# Altium project TYPEC_4KTransmitter-v1.0.PrjPcb (part 1 of 11)
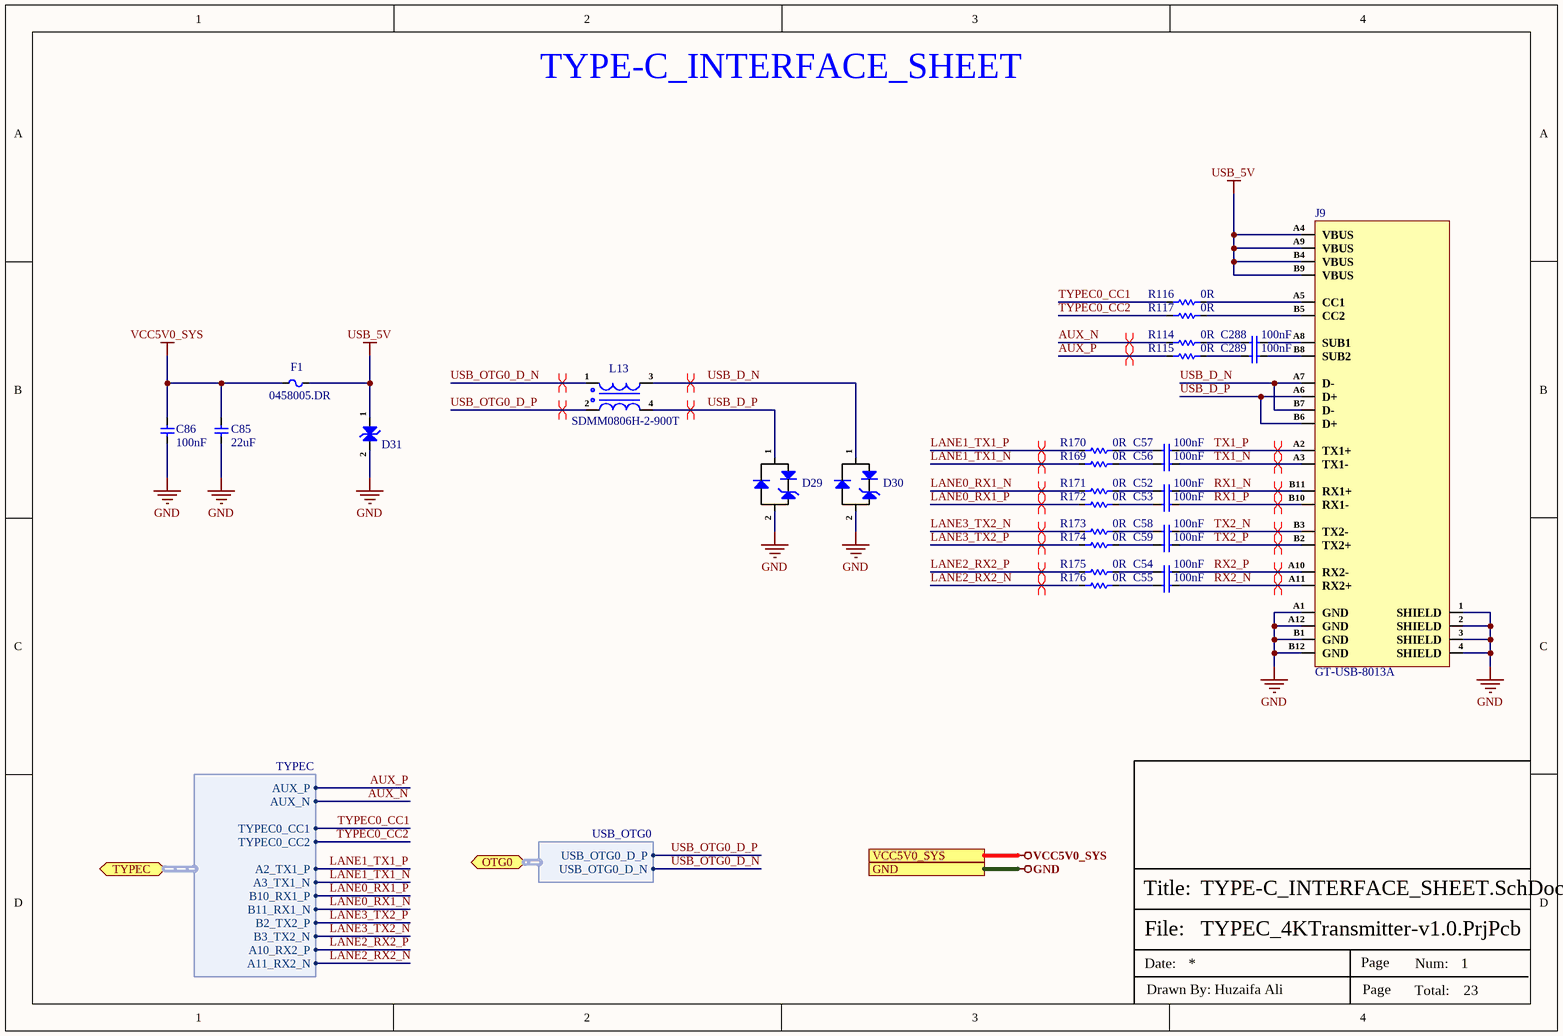
[diagram p0: TYPE-C_INTERFACE_SHEET.SchDoc]
23 sheets, 475 parts. Net scope: flat (ports and power ports of the same name join across sheets).
Board file: TYPEC_4KTransmitter-v1.0.PcbDoc
Sheets:
  TYPE-C_INTERFACE_SHEET.SchDoc
  POWER_LDO_SHEET.SchDoc
  POWER_OTHER_SHEET.SchDoc
  POWER_PMIC_RK809_DC DC.SchDoc
  POWER_PMIC_RK809_LDO.SchDoc
  POWER_PMIC_RK809_MGM.SchDoc
  POWER_PMIC_RK809_CODEC.SchDoc
  RK3566_POWER_SHEET.SchDoc
  RK3566_DDR-PHY_SHEET.SchDoc
  RK3566_OSC_PMUIO_SHEET.SchDoc
  RK3566_FLASH-SD_SHEET.SchDoc
  RK3566_SARADC_GPIO.SchDoc
  RK3566_USB_PCIe_SHEET.SchDoc
  RK3566_VI_SHEET.SchDoc
  RK3566_VO_SHEET_1.SchDoc
  RK3566_VO_SHEET_2.SchDoc
  RK3566_AUDIO_SHEET.SchDoc
  DRAM_LPDDR4_SHEET.SchDoc
  eMMC_SPI-FLASH_SHEET.SchDoc
  TYPE-C_TO_MIPI-CSI_SHEET.SchDoc
  HDMI2.0_SHEET.SchDoc
  USB2.0_SHEET.SchDoc
  WIFI-6_SHEET.SchDoc

## Sheet TYPE-C_INTERFACE_SHEET.SchDoc
size A4; SheetNumber: 1; SheetTotal: 23

### Parts
C52  100nF  [Cap-0402]
C53  100nF  [Cap-0402]
C54  100nF  [Cap-0402]
C55  100nF  [Cap-0402]
C56  100nF  [Cap-0402]
C57  100nF  [Cap-0402]
C58  100nF  [Cap-0402]
C59  100nF  [Cap-0402]
C85  22uF  [Cap-0603]
C86  100nF  [Cap-0402]
C288  100nF  [Cap-0402]
C289  100nF  [Cap-0402]
D29  ESD5341N-2/TR  [DFN1006-2L_]  (value not drawn)
D30  ESD5341N-2/TR  [DFN1006-2L_]  (value not drawn)
D31  ESD5451N  [DFN1006-2L (Bi-Directional)]  (value not drawn)
F1  0458005.DR  [Fuse 1206 (3216 Metric)]
J9  GT-USB-8013A  [GT-USB-8013A]
L13  SDMM0806H-2-900T  [0302]
R114  0R  [Res-0402]
R115  0R  [Res-0402]
R116  0R  [Res-0402]
R117  0R  [Res-0402]
R169  0R  [Res-0402]
R170  0R  [Res-0402]
R171  0R  [Res-0402]
R172  0R  [Res-0402]
R173  0R  [Res-0402]
R174  0R  [Res-0402]
R175  0R  [Res-0402]
R176  0R  [Res-0402]

### Ports
GND (see DRAM_LPDDR4_SHEET[6D], eMMC_SPI-FLASH_SHEET[1D], HDMI2.0_SHEET[3D], POWER_LDO_SHEET[3D], POWER_OTHER_SHEET[3C], POWER_PMIC_RK809_CODEC[3C], POWER_PMIC_RK809_DC DC[3D], POWER_PMIC_RK809_LDO[4C], POWER_PMIC_RK809_MGM[3D], RK3566_AUDIO_SHEET[3C], RK3566_DDR-PHY_SHEET[5D], RK3566_FLASH-SD_SHEET[4C], RK3566_OSC_PMUIO_SHEET[5D], RK3566_POWER_SHEET[3D], RK3566_SARADC_GPIO[3D], RK3566_USB_PCIe_SHEET[3D], RK3566_VI_SHEET[3D], RK3566_VO_SHEET_1[3C], RK3566_VO_SHEET_2[4C], TYPE-C_TO_MIPI-CSI_SHEET[5D], USB2.0_SHEET[3D], WIFI-6_SHEET[3D]), OTG0 (bidir, harness USB_OTG0, see RK3566_USB_PCIe_SHEET[3C]), TYPEC (bidir, harness TYPEC, see TYPE-C_TO_MIPI-CSI_SHEET[2D]), VCC5V0_SYS (see HDMI2.0_SHEET[3D], POWER_LDO_SHEET[3D], POWER_OTHER_SHEET[3C], POWER_PMIC_RK809_CODEC[3C], POWER_PMIC_RK809_MGM[3D], RK3566_USB_PCIe_SHEET[3C], USB2.0_SHEET[3D])

### Harnesses
USB_OTG0: USB_OTG0_D_P, USB_OTG0_D_N
TYPEC: TYPEC0_CC1, TYPEC0_CC2, AUX_N, AUX_P, A2_TX1_P, A3_TX1_N, B11_RX1_N, B10_RX1_P, B3_TX2_N, B2_TX2_P, A10_RX2_P, A11_RX2_N

### Nets
GND: C85.1 C86.1 D29.2(A) D30.2(A) D31.2(K) J9.1(SHIELD) J9.2(SHIELD) J9.3(SHIELD) J9.4(SHIELD) J9.A1(GND) J9.A12(GND) J9.B1(GND) J9.B12(GND) ; port GND
USB_5V: D31.1(K) F1.1 J9.A4(VBUS) J9.A9(VBUS) J9.B4(VBUS) J9.B9(VBUS)
VCC5V0_SYS: C85.2 C86.2 F1.2 ; port VCC5V0_SYS
AUX_N: R114.1 ; port TYPEC.AUX_N
AUX_P: R115.1 ; port TYPEC.AUX_P
LANE0_RX1_N: R171.1 ; port TYPEC.B11_RX1_N
LANE0_RX1_P: R172.1 ; port TYPEC.B10_RX1_P
LANE1_TX1_N: R169.1 ; port TYPEC.A3_TX1_N
LANE1_TX1_P: R170.1 ; port TYPEC.A2_TX1_P
LANE2_RX2_N: R176.1 ; port TYPEC.A11_RX2_N
LANE2_RX2_P: R175.1 ; port TYPEC.A10_RX2_P
LANE3_TX2_N: R173.1 ; port TYPEC.B3_TX2_N
LANE3_TX2_P: R174.1 ; port TYPEC.B2_TX2_P
RX1_N: C52.1 J9.B11(RX1+)
RX1_P: C53.1 J9.B10(RX1-)
RX2_N: C55.1 J9.A11(RX2+)
RX2_P: C54.1 J9.A10(RX2-)
TX1_N: C56.1 J9.A3(TX1-)
TX1_P: C57.1 J9.A2(TX1+)
TX2_N: C58.1 J9.B3(TX2-)
TX2_P: C59.1 J9.B2(TX2+)
TYPEC0_CC1: R116.1 ; port TYPEC.TYPEC0_CC1
TYPEC0_CC2: R117.1 ; port TYPEC.TYPEC0_CC2
USB_D_N: D30.1(K) J9.A7(D-) J9.B7(D-) L13.3
USB_D_P: D29.1(K) J9.A6(D+) J9.B6(D+) L13.4
USB_OTG0_D_N: L13.1 ; port OTG0.USB_OTG0_D_N
USB_OTG0_D_P: L13.2 ; port OTG0.USB_OTG0_D_P
NetC52_2: C52.2 R171.2
NetC53_2: C53.2 R172.2
NetC54_2: C54.2 R175.2
NetC55_2: C55.2 R176.2
NetC56_2: C56.2 R169.2
NetC57_2: C57.2 R170.2
NetC58_2: C58.2 R173.2
NetC59_2: C59.2 R174.2
NetC288_1: C288.1 J9.A8(SUB1)
NetC288_2: C288.2 R114.2
NetC289_1: C289.1 J9.B8(SUB2)
NetC289_2: C289.2 R115.2
NetJ9_A5: J9.A5(CC1) R116.2
NetJ9_B5: J9.B5(CC2) R117.2

### Layout directives
differential pair; differential pair class TYPEC_DP_LINES_90: AUX_N, AUX_P, LANE0_RX1_N, LANE0_RX1_P, LANE1_TX1_N, LANE1_TX1_P, LANE2_RX2_N, LANE2_RX2_P, LANE3_TX2_N, LANE3_TX2_P, RX1_N, RX1_P, RX2_N, RX2_P, TX1_N, TX1_P, TX2_N, TX2_P, USB_D_N, USB_D_P, USB_OTG0_D_N, USB_OTG0_D_P

### Notes on the sheet
- TYPE-C_INTERFACE_SHEET
- File:
- Title:
- Date:
- Page
- Num:
- Total:
- Drawn By: Huzaifa Ali

### Library data of the parts
C52-C59 C86 C288 C289 = CC0402KRX5R7BB104: CAP CER 0.1UF 16V X5R 0402; Manufacturer: Yageo; Tolerance: 10%; Supplier 1: Mouser; Manufacturer Part Number: CC0402KRX5R7BB104; RoHS: Yes; Category: Ceramic Capacitors; Stock 1: 936792; Pricing 1: 1=0.10000, 10=0.02300, 50=0.02300, 100=0.01100, 1000=0.00600, 10000=0.00400 (USD); Mount: Surface Mount; Case/Package: 0402; Case Code (Imperial): 0402; Case Code (Metric): 1005; Min Operating Temperature: -55°C; Max Operating Temperature: 85°C; Capacitance: 100nF; Dielectric: X5R; Voltage Rating (DC): 16V; Packaging: Tape and Reel; Termination: SMD/SMT; Resistor Type: Ceramic; Voltage Rating: 16V; Series: CC; Construction: Flat; Length: 1mm; Width: 0.02inch; Height: 0.5mm; Thickness: 0.022inch; Depth: 0.5mm; Radiation Hardening: No; Lead Free: Lead Free; Halogen Free: Halogen Free; RoHS Compliant: Yes; ComponentLink1URL: https://datasheet.ciiva.com/155/mlccorderingcode-155879.pdf?src-supplier=Digi-Key; ComponentLink1Description: https://datasheet.ciiva.com/155/mlccorderingcode-155879.pdf?src-supplier=Digi-Key; Supplier Part Number 1: 603-CC402KRX5R7BB104; LCSC Part Number: C106204; Number of Pins: 2; Package Quantity: 1; REACH SVHC: Unknown; ComponentLink2URL: https://datasheet.ciiva.com/155/mlccorderingcode-155878.pdf?src-supplier=Digi-Key; ComponentLink2Description: https://datasheet.ciiva.com/155/mlccorderingcode-155878.pdf?src-supplier=Digi-Key; ComponentLink3URL: https://datasheet.ciiva.com/155/mlccorderingcode-155880.pdf?src-supplier=Digi-Key; ComponentLink3Description: https://datasheet.ciiva.com/155/mlccorderingcode-155880.pdf?src-supplier=Digi-Key; ComponentLink4URL: https://datasheet.ciiva.com/11464/upy-gphc-x5r-4v-to-50v-12-11464869.pdf?src-supplier=Avnet; ComponentLink4Description: https://datasheet.ciiva.com/11464/upy-gphc-x5r-4v-to-50v-12-11464869.pdf?src-supplier=Avnet
C85 = HGC0603R5226M160NTHJ: 16V 22uF X5R ±20% 0603 Multilayer Ceramic Capacitors MLCC - SMD/SMT ROHS; Manufacturer: Chinocera; Manufacturer Part Number: HGC0603R5226M160NTHJ; ComponentLink1URL: https://www.lcsc.com/product-detail/Multilayer-Ceramic-Capacitors-MLCC-SMD-SMT_Chinocera-HGC0603R5226M160NTHJ_C22367828.html; ComponentLink1Description: LCSC; LCSC Part Number: C22367828; Item Type: Capacitor; Package: 0603
D29 D30 = ESD5341N-2/TR: 4A@8/20us 15V 7V 5V Unidirectional DFN1006-2L TVS ROHS; Manufacturer: WILLSEMI; Item Type: Diode; Manufacturer Part Number: ESD5341N-2/TR; Package: DFN1006-2L; ComponentLink1Description: LCSC; ComponentLink1URL: https://www.lcsc.com/product-detail/TVS_WILLSEMI-Will-Semicon-ESD5341N-2-TR_C239773.html; LCSC Part Number: C239773
D31 = ESD5451N: DFN1006-2(0402) ESD Protection Devices ROHS; Manufacturer: TECH PUBLIC; Manufacturer Part Number: ESD5451N; Footprint: DFN1006-2(0402); ComponentLink1Description: LCSC; ComponentLink1URL: https://www.lcsc.com/product-detail/span-style-background-color-ff0-ESD-span-Protection-Devices_TECH-PUBLIC-ESD5451N_C2936977.html; LCSC Part Number: C2936977
F1 = 0458005.DR: FUSE BRD MNT 5A 32VAC 75VDC 1206; Manufacturer: Littelfuse; Supplier: Rs; Supplier Part Number: 1740294; Manufacturer Part Number: 0458005.DR; RoHS: Yes; Category: Fuses; Stock: 1005; Pricing: 1=0.6241, 10=0.73892, 25=0.71895, 50=0.70003 (GBP); ComponentLink1URL: https://datasheet.ciiva.com/1730/337915-1730547.pdf?src-supplier=Newark; ComponentLink1Description: https://datasheet.ciiva.com/1730/337915-1730547.pdf?src-supplier=Newark; ComponentLink2URL: https://datasheet.ciiva.com/7991/337915-7991910.pdf?src-supplier=Element14; ComponentLink2Description: https://datasheet.ciiva.com/7991/337915-7991910.pdf?src-supplier=Element14; ComponentLink3URL: https://datasheet.ciiva.com/299/littelfuse-fuse-458-series-299786.pdf?src-supplier=Digikey; ComponentLink3Description: https://datasheet.ciiva.com/299/littelfuse-fuse-458-series-299786.pdf?src-supplier=Digikey; ComponentLink4URL: https://datasheet.ciiva.com/299/littelfuse-fuse-458-series-299787.pdf?src-supplier=Digikey; ComponentLink4Description: https://datasheet.ciiva.com/299/littelfuse-fuse-458-series-299787.pdf?src-supplier=Digikey; ComponentLink5URL: https://datasheet.ciiva.com/299/littelfuse-fuse-458-series-299788.pdf?src-supplier=Digikey; ComponentLink5Description: https://datasheet.ciiva.com/299/littelfuse-fuse-458-series-299788.pdf?src-supplier=Digikey; LCSC Part Number: C187561; Item Type: Fuse
J9 = GT-USB-8013A: 5A USB 3.1 1 Horizontal attachment 24P Male -40℃~+85℃ Type-C SMD USB Connectors ROHS; Manufacturer: G-Switch; Manufacturer Part Number: GT-USB-8013A; Package: SMD; LCSC Part Number: C2988370; Item Type: Connector; ComponentLink1Description: LCSC; ComponentLink1URL: https://www.lcsc.com/product-detail/span-style-background-color-ff0-USB-span-Connectors_G-Switch-GT-USB-8013A_C2988370.html
L13 = SDMM0806H-2-900T: 90Ω@100MHz 4Ω 2 0302 Common Mode Filters ROHS; Manufacturer: Sunlord; Manufacturer Part Number: SDMM0806H-2-900T; Package: 0302; LCSC Part Number: C370285; Item Type: Common Mode Filter; ComponentLink1Description: LCSC; ComponentLink1URL: https://www.lcsc.com/product-detail/Common-Mode-Filters_Sunlord-SDMM0806H-2-900T_C370285.html
R114-R117 R169-R176 = RC0402FR-070RL: RES 0 OHM JUMPER 1/16W 0402; Manufacturer: Yageo; Power Rating: 62.5mW; Tolerance: 1%; Voltage Rating: 50V; Max Power Dissipation: 63mW; Item Type: Resistors; Temperature Coefficient: 200ppm/°C; Supplier 1: Mouser; Manufacturer Part Number: RC0402FR-070RL; RoHS: Yes; Stock 1: 8556842; Pricing 1: 1=0.10000, 10=0.01400, 50=0.01400, 100=0.00600, 1000=0.00300, 5000=0.00200, 10000=0.00100 (USD); Case/Package: 0402; Contact Plating: Tin,Matte; Case Code (Metric): 1005; Case Code (Imperial): 0402; Size Code: 0402; Min Operating Temperature: -55°C; Max Operating Temperature: 155°C; Resistor Type: Thick Film; Resistance: 0R; Packaging: Tape and Reel; Number of Terminations: 2; Termination: SMD/SMT; Features: Moisture Resistant; Series: RC; Length: 1mm; Width: 0.5mm; Height: 0.35mm; Radiation Hardening: No; RoHS Compliant: Yes; Lead Free: Lead Free; ComponentLink1URL: https://datasheet.ciiva.com/8896/pyu-rc0402-51-rohs-l-6-8896149.pdf?src-supplier=Avnet; ComponentLink1Description: https://datasheet.ciiva.com/8896/pyu-rc0402-51-rohs-l-6-8896149.pdf?src-supplier=Avnet; ComponentLink2URL: https://datasheet.ciiva.com/16790/pyu-rc0402-51-rohs-l-6-r-16790444.pdf?src-supplier=Future+Electronics; ComponentLink2Description: https://datasheet.ciiva.com/16790/pyu-rc0402-51-rohs-l-6-r-16790444.pdf?src-supplier=Future+Electronics; Supplier Part Number 1: 603-RC0402FR-070RL; LCSC Part Number: C106231; Mount: Surface Mount

## Sheet POWER_LDO_SHEET.SchDoc
size A4; SheetNumber: 2; SheetTotal: 23
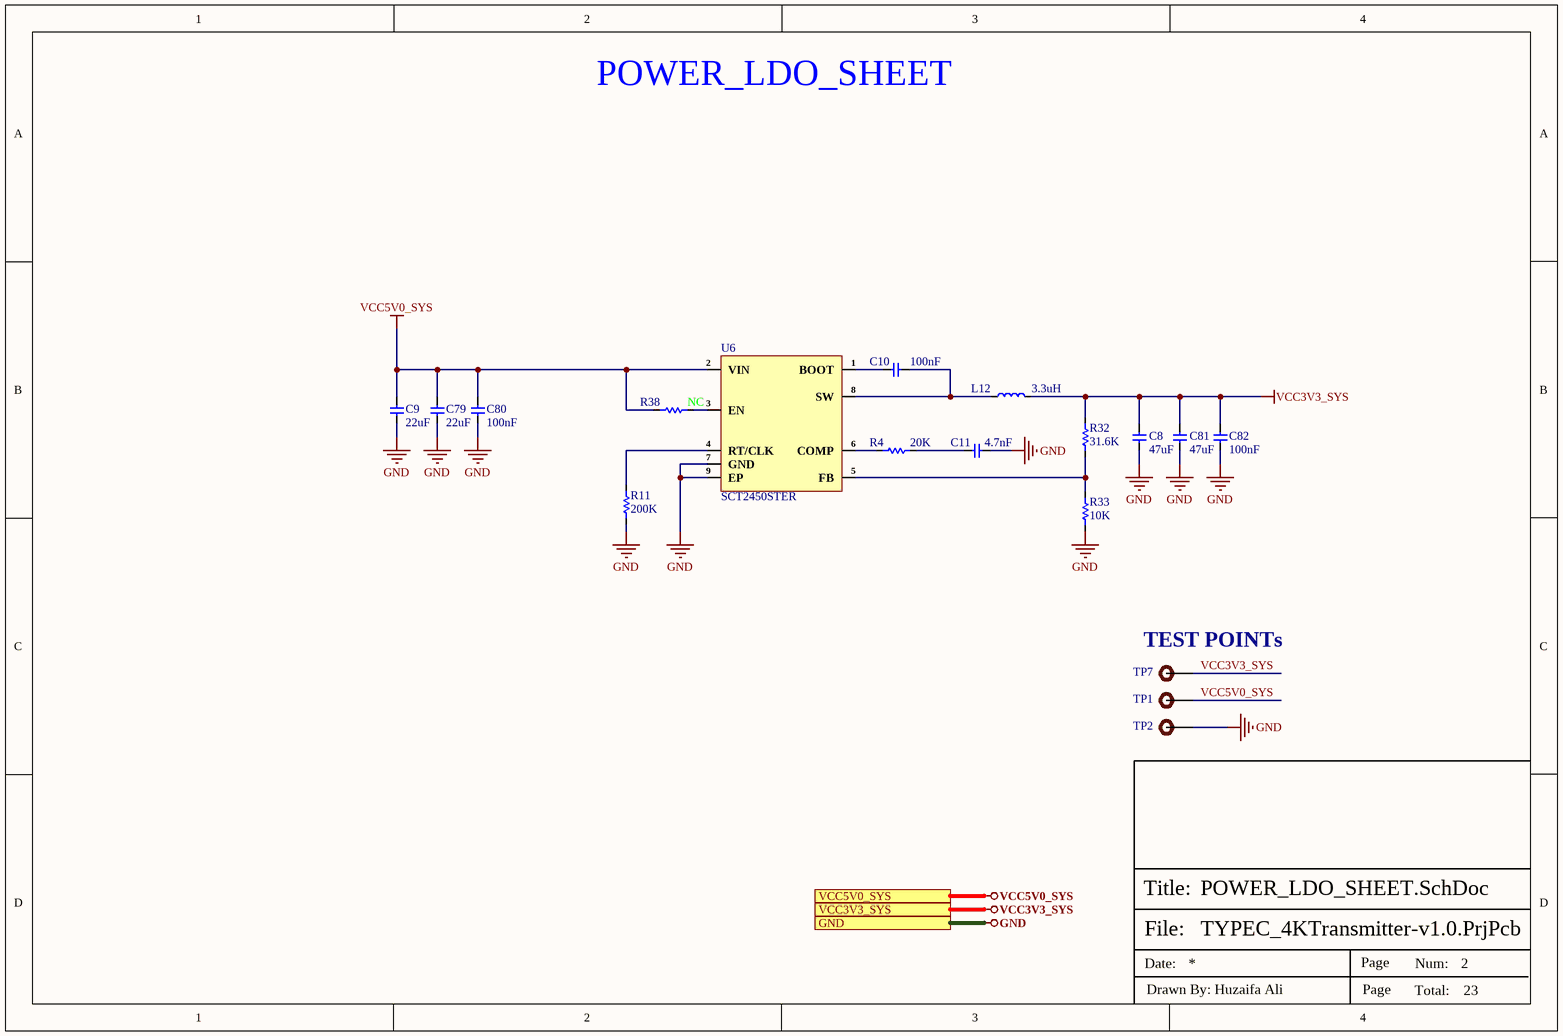
[diagram p1: POWER_LDO_SHEET.SchDoc]

### Parts
C8  47uF  [Cap-0805]
C9  22uF  [Cap-0805]
C10  100nF  [Cap-0402]
C11  4.7nF  [Cap-0402]
C79  22uF  [Cap-0805]
C80  100nF  [Cap-0402]
C81  47uF  [Cap-0805]
C82  100nF  [Cap-0603]
L12  3.3uH  [0630CDMCCDS-3R3MC]
R4  20K  [Res-0402]
R11  200K  [Res-0402]
R32  31.6K  [Res-0402]
R33  10K  [Res-0402]
R38  NC  [Res-0402]
TP1  TEST POINT 0.5mm Dia  [Test-point - 0.5mm]  (value not drawn)  (no BOM)
TP2  TEST POINT 0.5mm Dia  [Test-point - 0.5mm]  (value not drawn)  (no BOM)
TP7  TEST POINT 0.5mm Dia  [Test-point - 0.5mm]  (value not drawn)  (no BOM)
U6  SCT2450STER  [ESOP-8]

### Ports
GND (see DRAM_LPDDR4_SHEET[6D], eMMC_SPI-FLASH_SHEET[1D], HDMI2.0_SHEET[3D], POWER_OTHER_SHEET[3C], POWER_PMIC_RK809_CODEC[3C], POWER_PMIC_RK809_DC DC[3D], POWER_PMIC_RK809_LDO[4C], POWER_PMIC_RK809_MGM[3D], RK3566_AUDIO_SHEET[3C], RK3566_DDR-PHY_SHEET[5D], RK3566_FLASH-SD_SHEET[4C], RK3566_OSC_PMUIO_SHEET[5D], RK3566_POWER_SHEET[3D], RK3566_SARADC_GPIO[3D], RK3566_USB_PCIe_SHEET[3D], RK3566_VI_SHEET[3D], RK3566_VO_SHEET_1[3C], RK3566_VO_SHEET_2[4C], TYPE-C_INTERFACE_SHEET[3D], TYPE-C_TO_MIPI-CSI_SHEET[5D], USB2.0_SHEET[3D], WIFI-6_SHEET[3D]), VCC3V3_SYS (see DRAM_LPDDR4_SHEET[6D], POWER_OTHER_SHEET[3C], POWER_PMIC_RK809_DC DC[3D], POWER_PMIC_RK809_LDO[4C], POWER_PMIC_RK809_MGM[3D], RK3566_SARADC_GPIO[3D], TYPE-C_TO_MIPI-CSI_SHEET[5D], WIFI-6_SHEET[3D]), VCC5V0_SYS (see HDMI2.0_SHEET[3D], POWER_OTHER_SHEET[3C], POWER_PMIC_RK809_CODEC[3C], POWER_PMIC_RK809_MGM[3D], RK3566_USB_PCIe_SHEET[3C], TYPE-C_INTERFACE_SHEET[3D], USB2.0_SHEET[3D])

### Nets
GND: C8.1 C9.1 C11.2 C79.1 C80.1 C81.1 C82.1 R11.1 R33.2 TP2.1 U6.7(GND) U6.9(EP) ; port GND
VCC3V3_SYS: C8.2 C81.2 C82.2 L12.2 R32.1 TP7.1 ; port VCC3V3_SYS
VCC5V0_SYS: C9.2 C79.2 C80.2 R38.2 TP1.1 U6.2(VIN) ; port VCC5V0_SYS
NetC10_1: C10.1 U6.1(BOOT)
NetC10_2: C10.2 L12.1 U6.8(SW)
NetC11_1: C11.1 R4.2
NetR4_1: R4.1 U6.6(COMP)
NetR11_2: R11.2 U6.4(RT/CLK)
NetR32_2: R32.2 R33.1 U6.5(FB)
NetR38_1: R38.1 U6.3(EN)

### Notes on the sheet
- POWER_LDO_SHEET
- (near TP7) TEST POINTs
- File:
- Title:
- Date:
- Page
- Num:
- Total:
- Drawn By: Huzaifa Ali

### Library data of the parts
C8 C81 = GRM21BR61A476ME15K: CAP CER 47UF 10V X5R 0805; Manufacturer: Murata; Material: 4241ConductorMaterial; Tolerance: 20%; Item Type: Capacitors; Supplier: Future Electronics; Manufacturer Part Number: GRM21BR61A476ME15K; RoHS: Yes; Stock: 80000; Pricing: 10000=0.15 (USD); Case/Package: 0805; Min Operating Temperature: -55°C; Max Operating Temperature: 85°C; Value: 47uF; Dielectric: X5R; Voltage Rating: 10V; Voltage Rating (DC): 10V; Height: 1.45mm; LCSC Part Number: C2292827; Mounting Technology: Surface Mount; Case Code (Imperial): 0805; Case Code (Metric): 2012; Weight: 0.000335oz; Packaging: Tape and Reel; Termination: SMD/SMT; Package Quantity: 10000; Series: GRM; RoHS Compliant: Yes; ComponentLink1URL: http://www.mouser.com/ds/2/281/c02e-2905.pdf?src-supplier=Mouser; ComponentLink1Description: http://www.mouser.com/ds/2/281/c02e-2905.pdf?src-supplier=Mouser; ComponentLink2URL: http://psearch.en.murata.com/capacitor/product/GRM21BR61A476ME15%23.pdf?src-supplier=Avnet; ComponentLink2Description: http://psearch.en.murata.com/capacitor/product/GRM21BR61A476ME15%23.pdf?src-supplier=Avnet; ComponentLink3URL: https://www.murata.com/~/media/webrenewal/support/library/catalog/products/capacitor/mlcc/c02e.ashx?la=en-us&src-supplier=Digikey; ComponentLink3Description: https://www.murata.com/~/media/webrenewal/support/library/catalog/products/capacitor/mlcc/c02e.ashx?la=en-us&src-supplier=Digikey
C9 C79 = CL21A226MOCLRNC: CAP CER 22UF 16V X5R 0805; Manufacturer: Samsung; Tolerance: 20%; Item Type: Capacitor; Supplier 1: Arrow Electronics; Manufacturer Part Number: CL21A226MOCLRNC; RoHS: Yes; Category: Ceramic Capacitors; Stock 1: 10030; Pricing 1: 1=0.29150, 10=0.21440, 25=0.20710, 100=0.12030, 250=0.11910, 500=0.11790, 1000=0.09220, 3000=0.07810, 6000=0.07720, 15000=0.06700 (USD); Mounting Technology: Surface Mount; Case/Package: 0805; Case Code (Metric): 2012; Case Code (Imperial): 0805; Min Operating Temperature: -55°C; Max Operating Temperature: 85°C; Packaging: Tape and Reel; Value: 22uF; Voltage Rating: 16V; Length: 0.079inch; Width: 0.049inch; Thickness: 0.037inch; RoHS Compliant: Yes; ComponentLink1URL: http://www.samsungsem.com/kr/support/product-search/mlcc/CL21A226MOCLRNC.jsp?src-supplier=Digi-Key; ComponentLink1Description: http://www.samsungsem.com/kr/support/product-search/mlcc/CL21A226MOCLRNC.jsp?src-supplier=Digi-Key; Supplier Part Number 1: CL21A226MOCLRNC; LCSC Part Number: C398815
C10 C80 = CC0402KRX5R7BB104: as C52 on sheet TYPE-C_INTERFACE_SHEET; Supplier 1: Mouser; Manufacturer Part Number: CC0402KRX5R7BB104; RoHS: Yes; Category: Ceramic Capacitors; Stock 1: 936792; Pricing 1: 1=0.10000, 10=0.02300, 50=0.02300, 100=0.01100, 1000=0.00600, 10000=0.00400 (USD); Mount: Surface Mount; Case/Package: 0402; Number of Pins: 2; Case Code (Metric): 1005; Case Code (Imperial): 0402; Min Operating Temperature: -55°C; Max Operating Temperature: 85°C; Capacitance: 100nF; Dielectric: X5R; Packaging: Tape and Reel; Voltage Rating: 16V; Package Quantity: 1; Voltage Rating (DC): 16V; Termination: SMD/SMT; Resistor Type: Ceramic; Series: CC; Construction: Flat; Length: 1mm; Width: 0.02inch; Height: 0.5mm; Thickness: 0.022inch; Depth: 0.5mm; Radiation Hardening: No; REACH SVHC: Unknown; Lead Free: Lead Free; Halogen Free: Halogen Free; RoHS Compliant: Yes; ComponentLink1URL: https://datasheet.ciiva.com/155/mlccorderingcode-155879.pdf?src-supplier=Digi-Key; ComponentLink1Description: https://datasheet.ciiva.com/155/mlccorderingcode-155879.pdf?src-supplier=Digi-Key; ComponentLink2URL: https://datasheet.ciiva.com/155/mlccorderingcode-155878.pdf?src-supplier=Digi-Key; ComponentLink2Description: https://datasheet.ciiva.com/155/mlccorderingcode-155878.pdf?src-supplier=Digi-Key; ComponentLink3URL: https://datasheet.ciiva.com/155/mlccorderingcode-155880.pdf?src-supplier=Digi-Key; ComponentLink3Description: https://datasheet.ciiva.com/155/mlccorderingcode-155880.pdf?src-supplier=Digi-Key; ComponentLink4URL: https://datasheet.ciiva.com/11464/upy-gphc-x5r-4v-to-50v-12-11464869.pdf?src-supplier=Avnet; ComponentLink4Description: https://datasheet.ciiva.com/11464/upy-gphc-x5r-4v-to-50v-12-11464869.pdf?src-supplier=Avnet; Supplier Part Number 1: 603-CC402KRX5R7BB104; LCSC Part Number: C106204
C11 = CC0402KRX7R9BB472: CAP CER 4700PF 50V X7R 0402; Manufacturer: Yageo; Material: 4241ConductorMaterial; Tolerance: 10%; Temperature Coefficient: 30ppm/°C; Item Type: Capacitor; Supplier 1: Future Electronics; Manufacturer Part Number: CC0402KRX7R9BB472; RoHS: Yes; Category: Ceramic Capacitors; Stock 1: 1780000; Pricing 1: 10000=0.0021, 40000=0.002, 150000=0.0019, 400000=0.0018, 1000000=0.0017 (USD); Mount: Surface Mount; Case/Package: 0402; Number of Pins: 2NUMBER; Case Code (Imperial): 0402; Case Code (Metric): 1005; Min Operating Temperature: -55°C; Max Operating Temperature: 125°C; Capacitance: 4.7nF; Dielectric: X7R; Voltage Rating: 50V; Voltage Rating (DC): 50V; Packaging: Tape and Reel; Package Quantity: 1; Termination: SMD/SMT; Series: CC; Construction: Flat; Length: 1mm; Width: 0.02inch; Height: 0.5mm; Thickness: 0.022inch; Depth: 0.5mm; Radiation Hardening: No; Reach SVHC Compliant: No; RoHS Compliant: Yes; Halogen Free: 5694HalogenFree; Lead Free: 5697LeadFree; ComponentLink1URL: https://datasheet.ciiva.com/7978/1489800-7978108.pdf?src-supplier=Element14; ComponentLink1Description: https://datasheet.ciiva.com/7978/1489800-7978108.pdf?src-supplier=Element14; ComponentLink2URL: https://datasheet.ciiva.com/176/mlccorderingcode-176364.pdf?src-supplier=Digikey; ComponentLink2Description: https://datasheet.ciiva.com/176/mlccorderingcode-176364.pdf?src-supplier=Digikey; ComponentLink3URL: https://datasheet.ciiva.com/176/mlccorderingcode-176363.pdf?src-supplier=Digikey; ComponentLink3Description: https://datasheet.ciiva.com/176/mlccorderingcode-176363.pdf?src-supplier=Digikey; ComponentLink4URL: https://datasheet.ciiva.com/176/mlccorderingcode-176365.pdf?src-supplier=Digikey; ComponentLink4Description: https://datasheet.ciiva.com/176/mlccorderingcode-176365.pdf?src-supplier=Digikey; ComponentLink5URL: https://datasheet.ciiva.com/11586/upy-gphc-x7r-6-3v-to-50v-8-11586491.pdf?src-supplier=Avnet; ComponentLink5Description: https://datasheet.ciiva.com/11586/upy-gphc-x7r-6-3v-to-50v-8-11586491.pdf?src-supplier=Avnet; Supplier Part Number 1: 1989300
C82 = CC0603KRX5R9BB104: CAP CER 0.1UF 50V X5R 0603; Manufacturer: Yageo; Tolerance: 10%; Item Type: Capacitor; Supplier 1: Digi-Key; Manufacturer Part Number: CC0603KRX5R9BB104; RoHS: Yes; Category: Ceramic Capacitors; Stock 1: 152253; Pricing 1: 1=0.10000, 10=0.05200, 50=0.02820, 100=0.02310, 500=0.01648, 1000=0.01294 (USD); Mount: Surface Mount; Case/Package: 0603; Case Code (Metric): 1608; Case Code (Imperial): 0603; Min Operating Temperature: -55°C; Max Operating Temperature: 85°C; Capacitance: 100nF; Dielectric: X5R; Packaging: Tape and Reel; Voltage Rating: 50V; Package Quantity: 4000; Voltage Rating (DC): 50V; Termination: SMD/SMT; Length: 0.063inch; Width: 0.031inch; Thickness: 0.035inch; Lead Free: Lead Free; Halogen Free: Halogen Free; ComponentLink1URL: http://www.mouser.com/ds/2/447/Yageo_UPY-GP_NP0_16V-to-50V_9-358835.pdf?src-supplier=Mouser; ComponentLink1Description: http://www.mouser.com/ds/2/447/Yageo_UPY-GP_NP0_16V-to-50V_9-358835.pdf?src-supplier=Mouser; ComponentLink2URL: https://www.yageo.com/upload/media/product/productsearch/datasheet/mlcc/UPY-GPHC_X5R_4V-to-50V_26.pdf?src-supplier=Digi-Key; ComponentLink2Description: https://www.yageo.com/upload/media/product/productsearch/datasheet/mlcc/UPY-GPHC_X5R_4V-to-50V_26.pdf?src-supplier=Digi-Key; ComponentLink3URL: http://www.yageo.com/exep/pages/download/literatures/ProductSelectionGuide%202014_Final_2.pdf?src-supplier=Digi-Key; ComponentLink3Description: http://www.yageo.com/exep/pages/download/literatures/ProductSelectionGuide%202014_Final_2.pdf?src-supplier=Digi-Key; Supplier Part Number 1: 311-4046-1-ND; LCSC Part Number: C110022; Weight: 7.1E-05oz
L12 = 0630CDMCCDS-3R3MC: FIXED IND 3.3UH 8.4A 22MOHM SMD; Manufacturer: Sumida; Item Type: Inductor; Core Material: Metal; Saturation Current: 11.4A; Shielding: Shielded; DC Resistance (DCR): 22mR; Test Frequency: 100kHz; Tolerance: 20%; Supplier: Digikey; LCSC Part Number: C879414; Manufacturer Part Number: 0630CDMCCDS-3R3MC; RoHS: Yes; Stock: 66218; Pricing: 1=0.6, 10=0.51, 25=0.4632, 50=0.4354, 100=0.3614, 250=0.33356, 500=0.32624 (USD); Mounting Technology: Surface Mount; Case/Package: Nonstandard; Min Operating Temperature: -55°C; Max Operating Temperature: 125°C; Packaging: Tape and Reel; Value: 3.3uH; Current Rating: 8.4A; Series: 0630CDMC/DS; Length: 0.276inch; Width: 0.26inch; Height - Seated (Max): 0.118inch; RoHS Compliant: Yes; ComponentLink1URL: http://products.sumida.com/products/pdf/0630CDMCDDS.pdf?src-supplier=Digikey; ComponentLink1Description: http://products.sumida.com/products/pdf/0630CDMCDDS.pdf?src-supplier=Digikey; ComponentLink2URL: https://products.sumida.com/products/pdf/0630CDMCDDS.pdf?src-supplier=Digikey; ComponentLink2Description: https://products.sumida.com/products/pdf/0630CDMCDDS.pdf?src-supplier=Digikey; ComponentLink3URL: https://datasheet.octopart.com/0630CDMCCDS-3R3MC-Sumida-datasheet-111071315.pdf?src-supplier=Future+Electronics; ComponentLink3Description: https://datasheet.octopart.com/0630CDMCCDS-3R3MC-Sumida-datasheet-111071315.pdf?src-supplier=Future+Electronics
R4 = RC0402FR-0720KL: RES 20K OHM 1% 1/16W 0402; Manufacturer: Yageo; Resistance: 20kR; Power Rating: 62.5mW; Voltage Rating: 50V; Temperature Coefficient: 100ppm/°C; Max Power Dissipation: 63mW; Item Type: Resistor; Supplier 1: Avnet; Manufacturer Part Number: RC0402FR-0720KL; RoHS: Yes; Category: Chip SMD Resistors; Stock 1: 1960708; Pricing 1: 10000=0.00085 (USD); Case/Package: 0402; Number of Pins: 2; Case Code (Metric): 1005; Case Code (Imperial): 0402; Size Code: 0402; Min Operating Temperature: -55°C; Max Operating Temperature: 155°C; Tolerance: 1%; Package Quantity: 1; Packaging: Tape and Reel; Resistor Type: Thick Film; Number of Terminations: 2; Termination: SMD/SMT; Voltage Rating (DC): 50V; Features: Moisture Resistant; Series: RC; Technology: THICK FILM; Resistance Tolerance: 1%; Construction: Rectangular; Length: 1mm; Width: 0.02inch; Height: 0.016inch; Depth: 0.5mm; RoHS Compliant: Yes; Reach SVHC Compliant: Yes; Military Standard: Not; Lead Free: Lead Free; ComponentLink1URL: https://datasheet.ciiva.com/11808/0900766b80c66297-11808454.pdf?src-supplier=RSComponents; ComponentLink1Description: https://datasheet.ciiva.com/11808/0900766b80c66297-11808454.pdf?src-supplier=RSComponents; ComponentLink2URL: https://datasheet.ciiva.com/7983/1018594-7983511.pdf?src-supplier=Element14; ComponentLink2Description: https://datasheet.ciiva.com/7983/1018594-7983511.pdf?src-supplier=Element14; ComponentLink3URL: https://datasheet.ciiva.com/46394/1018594-46394974.pdf?src-supplier=Element14; ComponentLink3Description: https://datasheet.ciiva.com/46394/1018594-46394974.pdf?src-supplier=Element14; ComponentLink4URL: https://datasheet.ciiva.com/2453/pyu-r-int-thick-7-2453494.pdf?src-supplier=Digi-Key; ComponentLink4Description: https://datasheet.ciiva.com/2453/pyu-r-int-thick-7-2453494.pdf?src-supplier=Digi-Key; ComponentLink5URL: https://datasheet.ciiva.com/2453/pyu-r-int-thick-7-2453495.pdf?src-supplier=Digi-Key; ComponentLink5Description: https://datasheet.ciiva.com/2453/pyu-r-int-thick-7-2453495.pdf?src-supplier=Digi-Key; ComponentLink6URL: https://datasheet.ciiva.com/2453/pyu-r-int-thick-7-2453493.pdf?src-supplier=Digi-Key; ComponentLink6Description: https://datasheet.ciiva.com/2453/pyu-r-int-thick-7-2453493.pdf?src-supplier=Digi-Key; ComponentLink7URL: https://datasheet.ciiva.com/12558/pyu-rc0402-51-rohs-l-6-r-8721-12558796.pdf?src-supplier=Mouser; ComponentLink7Description: https://datasheet.ciiva.com/12558/pyu-rc0402-51-rohs-l-6-r-8721-12558796.pdf?src-supplier=Mouser; Supplier Part Number 1: RC0402FR-0720KL; LCSC Part Number: C93942
R11 = RC0402FR-07200KL: RES 200K OHM 1% 1/16W 0402; Manufacturer: Yageo; Item Type: Resistor; Power Rating: 63mW; Temperature Coefficient: 100ppm/°C; Value: 200kR; Voltage Rating: 50V; Supplier: Future Electronics; LCSC Part Number: C114763; Manufacturer Part Number: RC0402FR-07200KL; RoHS: Yes; Stock: 290000; Pricing: 10000=0.0004, 50000=0.0008, 150000=0.0004, 300000=0.0007, 400000=0.0004, 1000000=0.0004, 2500000=0.0004, 3000000=0.0006 (USD); Case/Package: 0402; Case Code (Metric): 1005; Case Code (Imperial): 0402; Min Operating Temperature: -55°C; Max Operating Temperature: 155°C; Tolerance: 1%; Packaging: Tape and Reel; Termination: SMD/SMT; Series: RC; Technology: THICK FILM; Package Quantity: 1; Resistor Type: Thick Film; Number of Terminations: 2; Max Power Dissipation: 63mW; Working Voltage: 50V; Features: Moisture Resistant; Construction: Rectangular; Resistance Tolerance: 1%; Voltage Rating (DC): 50V; Length: 0.039inch; Width: 0.02inch; Height: 0.016inch; Depth: 0.5mm; RoHS Compliant: Yes; Lead Free: 5697LeadFree; Military Standard: Not; Reach SVHC Compliant: Unknown; ComponentLink1URL: https://datasheet.ciiva.com/7849/1018594-7849897.pdf?src-supplier=Element14; ComponentLink1Description: https://datasheet.ciiva.com/7849/1018594-7849897.pdf?src-supplier=Element14; ComponentLink2URL: https://datasheet.ciiva.com/7849/1018594-7849896.pdf?src-supplier=Element14; ComponentLink2Description: https://datasheet.ciiva.com/7849/1018594-7849896.pdf?src-supplier=Element14; ComponentLink3URL: https://datasheet.ciiva.com/46394/1018594-46394953.pdf?src-supplier=Element14; ComponentLink3Description: https://datasheet.ciiva.com/46394/1018594-46394953.pdf?src-supplier=Element14; ComponentLink4URL: https://datasheet.ciiva.com/2453/pyu-r-int-thick-7-2453557.pdf?src-supplier=Digikey; ComponentLink4Description: https://datasheet.ciiva.com/2453/pyu-r-int-thick-7-2453557.pdf?src-supplier=Digikey; ComponentLink5URL: https://datasheet.ciiva.com/2453/pyu-r-int-thick-7-2453558.pdf?src-supplier=Digikey; ComponentLink5Description: https://datasheet.ciiva.com/2453/pyu-r-int-thick-7-2453558.pdf?src-supplier=Digikey; ComponentLink6URL: https://datasheet.ciiva.com/2453/pyu-r-int-thick-7-2453556.pdf?src-supplier=Digikey; ComponentLink6Description: https://datasheet.ciiva.com/2453/pyu-r-int-thick-7-2453556.pdf?src-supplier=Digikey; ComponentLink7URL: https://datasheet.ciiva.com/12667/pyu-rc0402-51-rohs-l-6-r-12667911.pdf?src-supplier=Mouser; ComponentLink7Description: https://datasheet.ciiva.com/12667/pyu-rc0402-51-rohs-l-6-r-12667911.pdf?src-supplier=Mouser; ComponentLink8URL: https://datasheet.ciiva.com/15189/getdatasheetpartid-323720-15189381.pdf?src-supplier=Verical; ComponentLink8Description: https://datasheet.ciiva.com/15189/getdatasheetpartid-323720-15189381.pdf?src-supplier=Verical; ComponentLink9URL: https://datasheet.ciiva.com/16740/pyu-rc0402-51-rohs-l-6-r-16740636.pdf?src-supplier=Future+Electronics; ComponentLink9Description: https://datasheet.ciiva.com/16740/pyu-rc0402-51-rohs-l-6-r-16740636.pdf?src-supplier=Future+Electronics
R32 = RT0402DRE0731K6L: RES SMD 31.6KOHM 0.5% 1/16W 0402; Manufacturer: Yageo; Item Type: Resistors; Voltage Rating: 50V; Supplier: Digikey; LCSC Part Number: C853910; Manufacturer Part Number: RT0402DRE0731K6L; RoHS: Yes; Stock: 33568; Pricing: 1=0.1, 10=0.064, 50=0.0514, 100=0.0465, 500=0.03604, 1000=0.03205, 5000=0.02406 (USD); Voltage Rating (DC): 50V; Lead Free: 5697LeadFree; ComponentLink1URL: http://www.yageo.com/documents/recent/PYu-RT_1-to-0.01_RoHS_L_9.pdf?src-supplier=Digikey; ComponentLink1Description: http://www.yageo.com/documents/recent/PYu-RT_1-to-0.01_RoHS_L_9.pdf?src-supplier=Digikey; ComponentLink2URL: https://www.yageo.com/upload/media/product/productsearch/datasheet/rchip/PYu-RT_1-to-0.01_RoHS_L_11.pdf?src-supplier=Digikey; ComponentLink2Description: https://www.yageo.com/upload/media/product/productsearch/datasheet/rchip/PYu-RT_1-to-0.01_RoHS_L_11.pdf?src-supplier=Digikey; ComponentLink3URL: https://datasheet.octopart.com/RT0402DRE0731K6L-Yageo-datasheet-166250672.pdf?src-supplier=Future+Electronics; ComponentLink3Description: https://datasheet.octopart.com/RT0402DRE0731K6L-Yageo-datasheet-166250672.pdf?src-supplier=Future+Electronics
R33 = RE0402DRE0710KL: RES SMD 10K OHM 0.5% 1/16W 0402; Manufacturer: Yageo; Value: 10kR; Max Power Dissipation: 63mW; Temperature Coefficient: 50ppm/°C; Item Type: Resistor; Supplier: Future Electronics; Supplier Part Number: 8132697; Manufacturer Part Number: RE0402DRE0710KL; RoHS: Yes; Category: Chip SMD Resistors; Stock: 10000; Pricing: 10000=0.0059, 40000=0.0056, 150000=0.0053, 250000=0.0052, 500000=0.0049 (USD); Case/Package: 0402; Min Operating Temperature: -55°C; Max Operating Temperature: 155°C; Packaging: Tape and Reel; Number of Terminations: 2; Tolerance: 0.5%; Features: Moisture Resistant; Series: RE; Length: 0.039inch; Width: 0.02inch; Height: 0.015inch; RoHS Compliant: Yes; ComponentLink1URL: http://www.yageo.com/NewPortal/yageodocoutput?fileName=/pdf/R-Chip/PYu-RE_105_RoHS_L_6.pdf&src-supplier=Digi-Key; ComponentLink1Description: http://www.yageo.com/NewPortal/yageodocoutput?fileName=/pdf/R-Chip/PYu-RE_105_RoHS_L_6.pdf&src-supplier=Digi-Key; LCSC Part Number: C851874
R38 = RC0402FR-070RL: RES 0 OHM JUMPER 1/16W 0402; Manufacturer: Yageo; Item Type: Resistors; Resistance: 0R; Tolerance: 1%; Power Rating: 62.5mW; Voltage Rating: 50V; Temperature Coefficient: 200ppm/°C; Max Power Dissipation: 63mW; Supplier 1: Mouser; Manufacturer Part Number: RC0402FR-070RL; RoHS: Yes; Stock 1: 8556842; Pricing 1: 1=0.10000, 10=0.01400, 50=0.01400, 100=0.00600, 1000=0.00300, 5000=0.00200, 10000=0.00100 (USD); Mount: Surface Mount; Case/Package: 0402; Contact Plating: Tin,Matte; Case Code (Imperial): 0402; Case Code (Metric): 1005; Size Code: 0402; Min Operating Temperature: -55°C; Max Operating Temperature: 155°C; Resistor Type: Thick Film; Packaging: Tape and Reel; Termination: SMD/SMT; Features: Moisture Resistant; Series: RC; Number of Terminations: 2; Length: 1mm; Width: 0.5mm; Height: 0.35mm; Radiation Hardening: No; Lead Free: Lead Free; RoHS Compliant: Yes; ComponentLink1URL: https://datasheet.ciiva.com/8896/pyu-rc0402-51-rohs-l-6-8896149.pdf?src-supplier=Avnet; ComponentLink1Description: https://datasheet.ciiva.com/8896/pyu-rc0402-51-rohs-l-6-8896149.pdf?src-supplier=Avnet; ComponentLink2URL: https://datasheet.ciiva.com/16790/pyu-rc0402-51-rohs-l-6-r-16790444.pdf?src-supplier=Future+Electronics; ComponentLink2Description: https://datasheet.ciiva.com/16790/pyu-rc0402-51-rohs-l-6-r-16790444.pdf?src-supplier=Future+Electronics; Supplier Part Number 1: 603-RC0402FR-070RL; LCSC Part Number: C106231
TP1 TP2 TP7 = TEST POINT 0.5mm Dia: Test Point ON; Item Type: Test Point; Manufacturer Part Number: TEST POINT 0.5mm Dia
U6 = SCT2450STER: Step-down type 3.8V~36V 5A ESOP-8 DC-DC Converters ROHS; Manufacturer: SCT; Item Type: IC; Supplier: LCSC; LCSC Part Number: C509400; Manufacturer Part Number: SCT2450STER; RoHS: No